# Altium schematic sheet Power.SchDoc
size A4; SheetNumber: 3; SheetTotal: 4
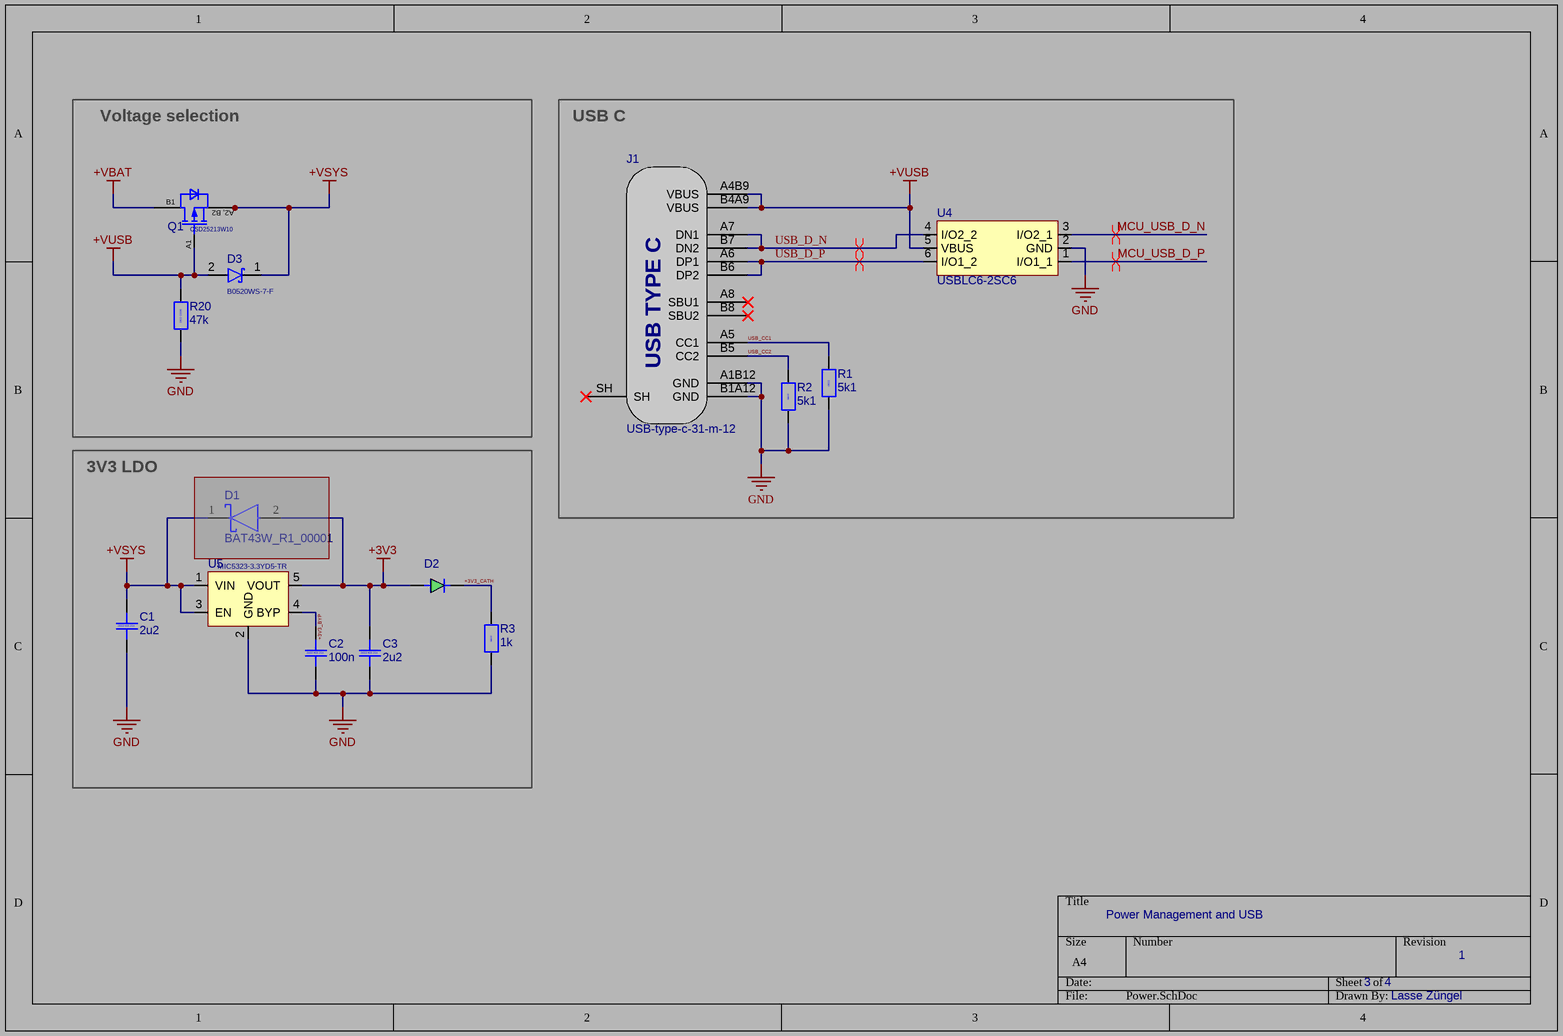
[diagram p0: Power.SchDoc]

## Parts
C1  2u2  [CAP_0603_L]
C2  100n  [CAP_0402]
C3  2u2  [CAP_0603_L]
D1  BAT43W_R1_00001  [SOD123]  (masked out: inside a compile mask, not in the netlist)
D2  SMD_LED_0603  [SMD_LED_0603]  (value not drawn)
D3  B0520WS-7-F  [SOD323]
J1  USB-type-c-31-m-12  [USB-type-c-31-m-12]
Q1  CSD25213W10  [CSD25213W10]
R1  5k1  [RES_0603]
R2  5k1  [RES_0603]
R3  1k  [RES_0603]
R20  47k  [RES_0402]
U4  USBLC6-2SC6  [SOT95P280X145-6N]
U5  MIC5323-3.3YD5-TR  [SPX3819M5-L-3-3/TR]

## Blocks framed on the sheet
Voltage selection: D3 Q1 R20
USB C: J1 R1 R2 U4
3V3 LDO: C1-C3 D1 D2 R3 U5

## Nets
+3V3: C3.2 D2.1 U5.5(VOUT)
+VBAT: Q1.B1(Drain)
+VSYS: C1.2 D3.1 Q1.A2(Source) Q1.B2(Source) U5.1(VIN) U5.3(EN)
+VUSB: D3.2 J1.A4B9(VBUS) J1.B4A9(VBUS) Q1.A1(Gate) R20.2 U4.5(VBUS)
GND: C1.1 C2.1 C3.1 J1.A1B12(GND) J1.B1A12(GND) R1.1 R2.1 R3.1 R20.1 U4.2(GND) U5.2(GND)
+3V3_BYP: C2.2 U5.4(BYP)
+3V3_CATH: D2.2 R3.2
MCU_USB_D_N: U4.3(I/O2_1)
MCU_USB_D_P: U4.1(I/O1_1)
USB_CC1: J1.A5(CC1) R1.2
USB_CC2: J1.B5(CC2) R2.2
USB_D_N: J1.A7(DN1) J1.B7(DN2) U4.4(I/O2_2)
USB_D_P: J1.A6(DP1) J1.B6(DP2) U4.6(I/O1_2)

Not connected (* = marked no-connect by the designer): J1 A8(SBU1)* B8(SBU2)* SH*

## Layout directives
differential pair: USB_D_N, USB_D_P
differential pair; differential pair class DIFFPAIRUSBMCU: MCU_USB_D_N, MCU_USB_D_P

## Notes on the sheet
- Power Management and USB
- 3    4
- 1
- Lasse Züngel
- (in symbol CAP_0402_X5R_25V) 0402 X5R 25V
- (in symbol CAP_0603_X5R_25V) 0603 X5R 25V
- (in symbol CSD25213W10) A2, B2
- (in symbol RES_0402) 0402 1/16W
- (in symbol RES_0603) 0603
- (in symbol USB-type-c-31-m-12) USB TYPE C

## Library data of the parts
C1 C3 = CAP_0603_X5R_25V: Capacitor 0603 generic, X5R, 25V
C2 = CAP_0402_X5R_25V: Capacitor 0402 generic, X5R, 25V
D1 = BAT43W_R1_00001: Schottky Diodes & Rectifiers 30V,Schottky,SOD-123,0.2A; Supplier Part Number 1: 3757-BAT43W_R1_00001CT-ND; Supplier 1: Digikey
D3 = B0520WS-7-F: DIODE SCHOTTKY 20V 500MA SOD323
Q1 = CSD25213W10: -20-V, P channel NexFET™ power MOSFET, single WLP 1 mm x 1 mm, 47 mOhm, gate ESD protection; MPN: CSD25213W10
R1-R3 = RES_0603: Resistor 0603 generic
R20 = RES_0402: Resistor 0402 generic, 1/16W
U4 = USBLC6-2SC6: ESD Protection Diodes / TVS Diodes ESD Protection Low Cap; Manufacturer_Name: STMicroelectronics; Datasheet Link: http://www.st.com/st-web-ui/static/active/en/resource/technical/document/datasheet/CD00050750.pdf; Height: 1.45mm; Manufacturer_Part_Number: USBLC6-2SC6; Mouser Part Number: 511-USBLC6-2SC6; Mouser Price/Stock: https://www.mouser.co.uk/ProductDetail/STMicroelectronics/USBLC6-2SC6?qs=po45yt2pPpu%2FhNIlwQdTlg%3D%3D; Arrow Part Number: USBLC6-2SC6; Arrow Price/Stock: https://www.arrow.com/en/products/usblc6-2sc6/stmicroelectronics?region=nac
U5 = MIC5323-3.3YD5-TR: LDO Voltage Regulators 300mA uCap ULDO High PSRR Low Noise Regulator